# Altium schematic sheet Base.SchDoc
size 420 x 297 mm; PageSetup: Record=PageOptions|CenterHorizontal=True|CenterVertical=True|PrintScale=0.94|XCorrection=1.00|YCorrection=1.00|PrintKind=1|BorderSize=5000000|LeftOffset=0|BottomOffset=0|Orientation=1|PaperLength=1000|PaperWidth=1000|Scale=100|PaperSource=7|PrintQuality=-4|MediaType=1|DitherType=10|PaperKind=A4|PrintScaleMode=1; HeadOfSector: Нач. сектора; Name: Base; NameShort: Основна плата; Litera: A; SCH_VERSION: Версия 0
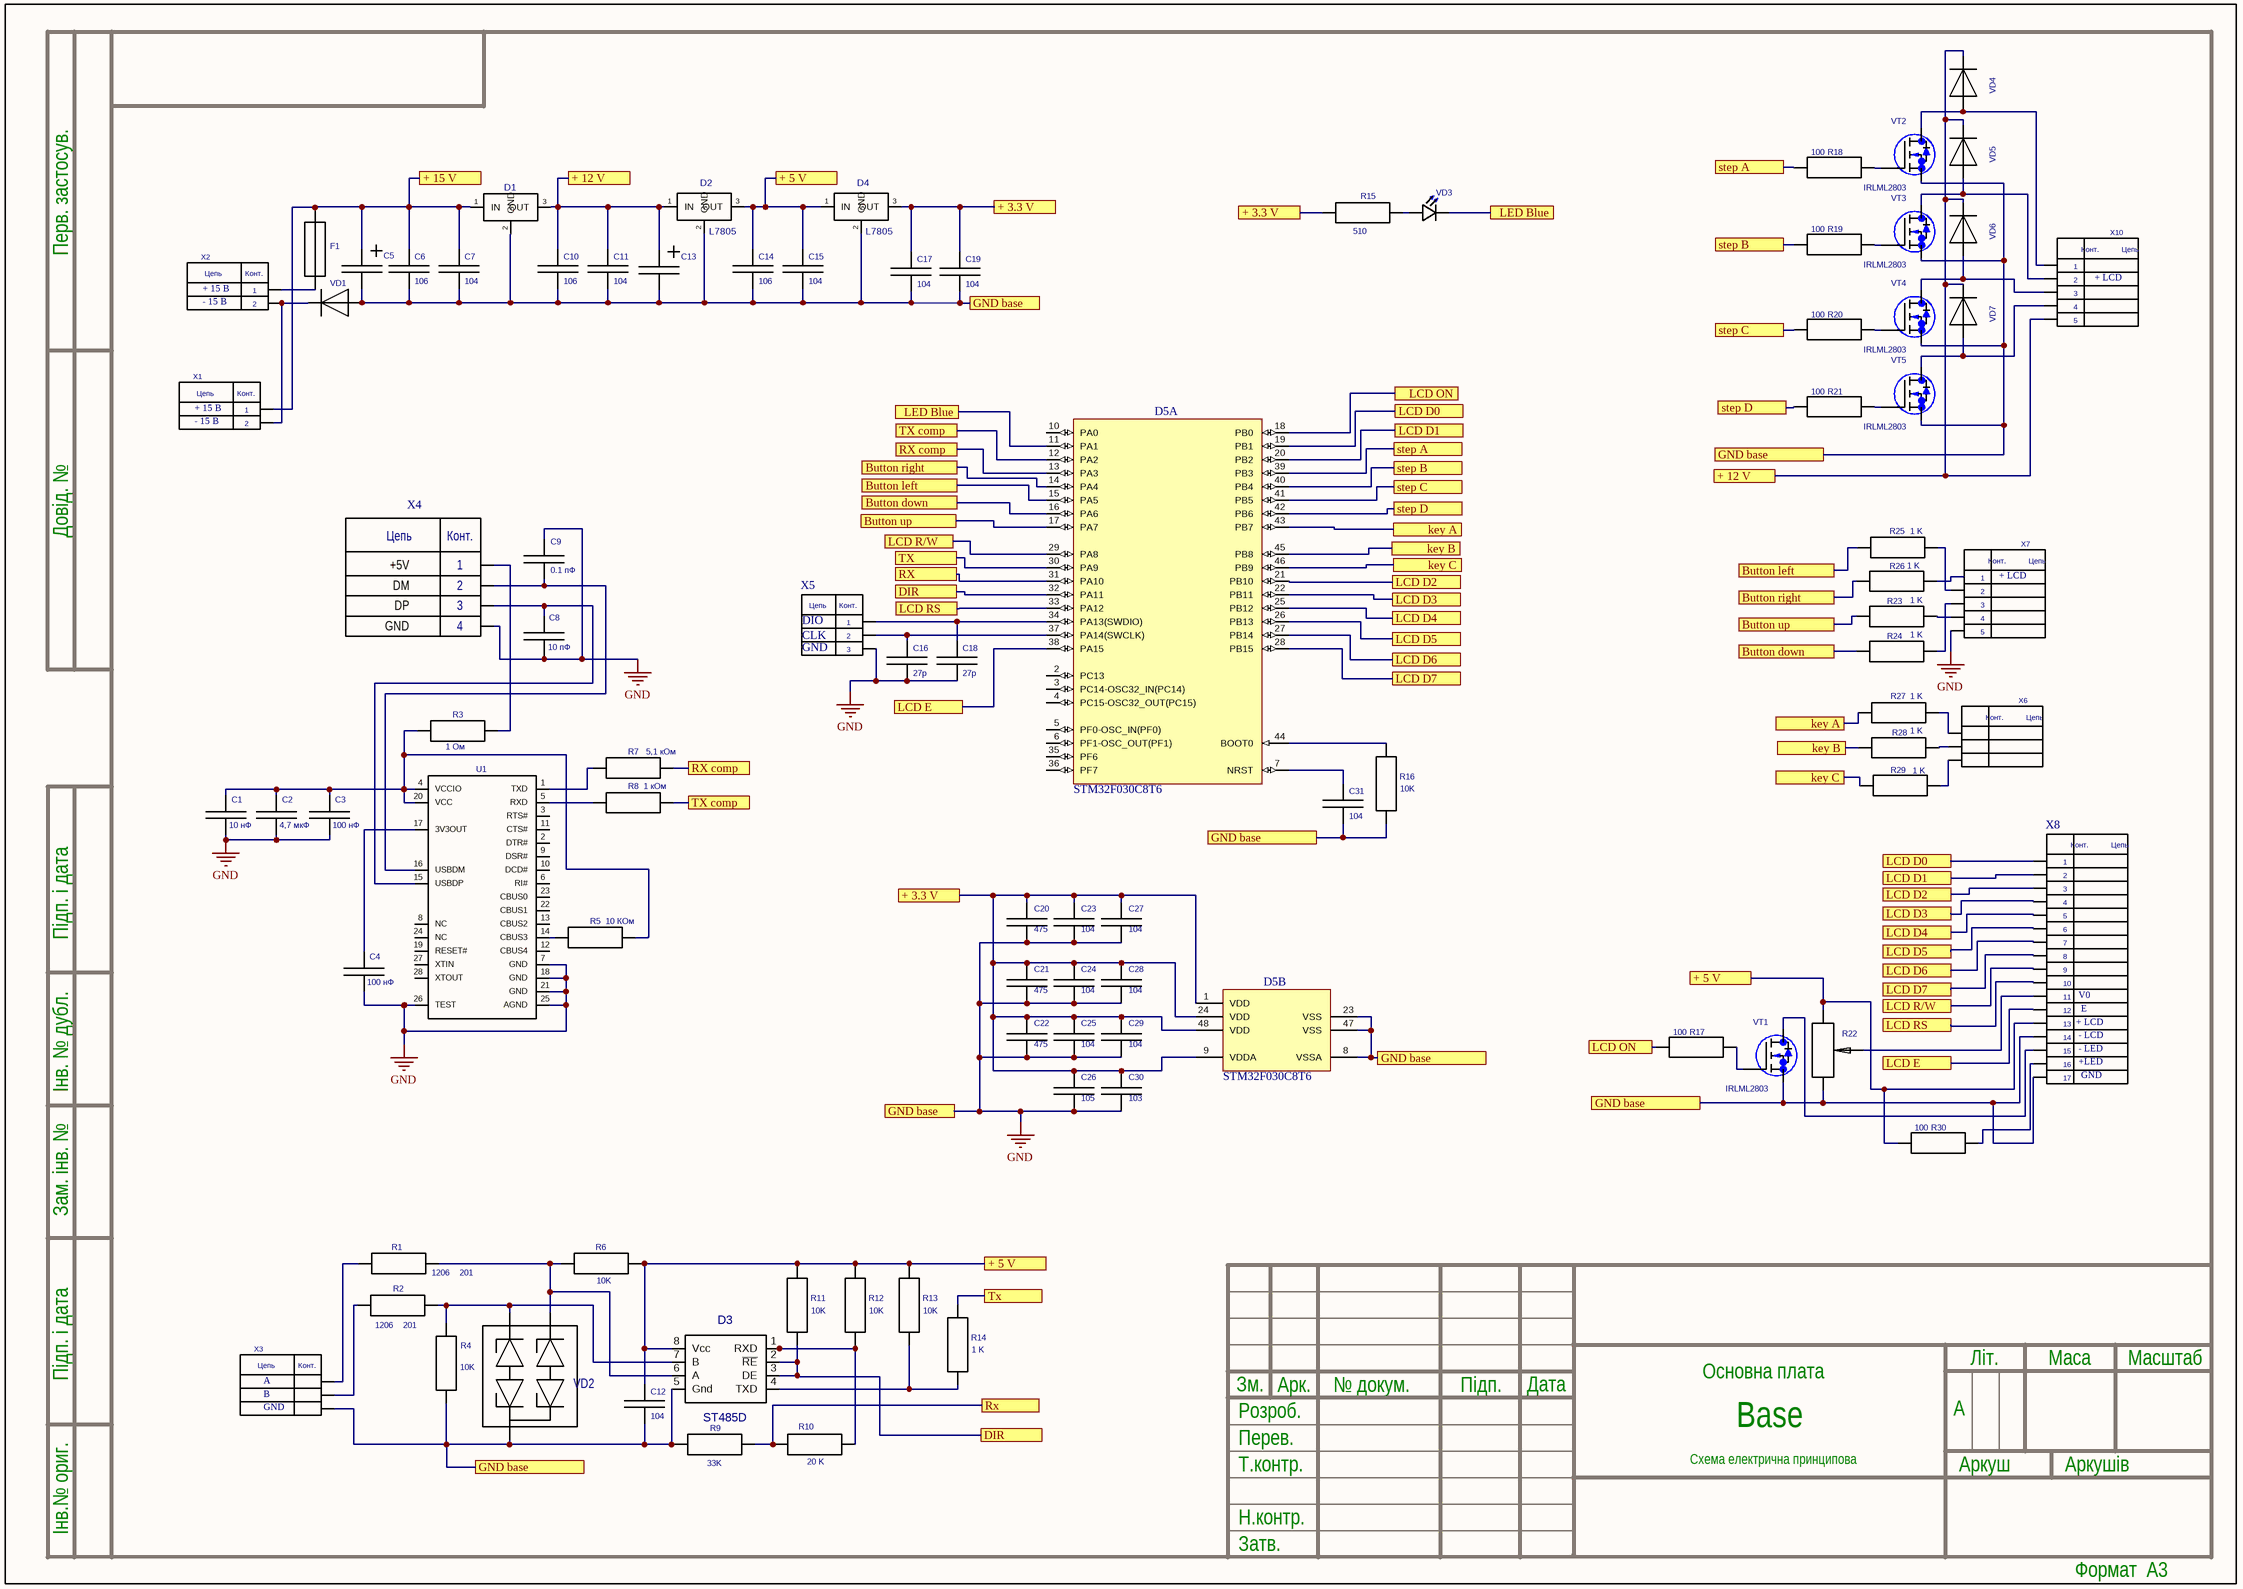
[diagram p0: Base.SchDoc]

## Parts
C1  value 10 нФ  [0805T]  (hidden comment: CC0805)
C2  value 4,7 мкФ  [0805T]  (hidden comment: CC0805)
C3  value 100 нФ  [0805T]  (hidden comment: CC0805)
C4  value 100 нФ  [0805T]  (hidden comment: CC0805)
C5  C-RAD-2_5-6_8  [C_electrolit_smd_7mm]  (value not drawn)
C6  value 106  [0805T]  (hidden comment: CC0805)
C7  value 104  [0805T]  (hidden comment: CC0805)
C8  value 10 пФ  [0805T]  (hidden comment: CC0805)
C9  value 0.1 пФ  [0805T]  (hidden comment: CC0805)
C10  value 106  [0805T]  (hidden comment: CC0805)
C11  value 104  [0805T]  (hidden comment: CC0805)
C12  value 104  [0805T]  (hidden comment: CC0805)
C13  C-RAD-2_5-6_8  [C_electrolit_smd_7mm]  (value not drawn)
C14  value 106  [0805T]  (hidden comment: CC0805)
C15  value 104  [0805T]  (hidden comment: CC0805)
C16  value 27p  [0805T]  (hidden comment: CC0805)
C17  value 104  [0805T]  (hidden comment: CC0805)
C18  value 27p  [0805T]  (hidden comment: CC0805)
C19  value 104  [0805T]  (hidden comment: CC0805)
C20  value 475  [0805T]  (hidden comment: CC0805)
C21  value 475  [0805T]  (hidden comment: CC0805)
C22  value 475  [0805T]  (hidden comment: CC0805)
C23  value 104  [0805T]  (hidden comment: CC0805)
C24  value 104  [0805T]  (hidden comment: CC0805)
C25  value 104  [0805T]  (hidden comment: CC0805)
C26  value 105  [0805T]  (hidden comment: CC0805)
C27  value 104  [0805T]  (hidden comment: CC0805)
C28  value 104  [0805T]  (hidden comment: CC0805)
C29  value 104  [0805T]  (hidden comment: CC0805)
C30  value 103  [0805T]  (hidden comment: CC0805)
C31  value 104  [0805T]  (hidden comment: CC0805)
D1  L78-D2PAK  [D2PAK(IR)]  (value not drawn)
D2  value L7805  [TO92-LM_TL431_TO93(Primary)]  (hidden comment: L78-D2PAK)
D3  ST485D  [SO8]
D4  value L7805  [TO92-LM_TL431_TO93(Primary)]  (hidden comment: L78-D2PAK)
D5  STM32F030C8T6  [LQFP48]  (parts A,B of 2)
F1  F  [F]  (value not drawn)
R1  value 1206    201  [RC1206_IPC]  (hidden comment: 201)
R2  value 1206    201  [RC1206_IPC]  (hidden comment: 201)
R3  value 1 Ом  [RC0805]  (hidden comment: R0805MY)
R4  value 10K  [RC0805]  (hidden comment: R0805MY)
R5  value 10 КОм  [RC0805]  (hidden comment: R0805MY)
R6  value 10K  [RC0805]  (hidden comment: R0805MY)
R7  value 5,1 кОм  [RC0805]  (hidden comment: R0805MY)
R8  value 1 кОм  [RC0805]  (hidden comment: R0805MY)
R9  value 33K  [RC0805]  (hidden comment: R0805MY)
R10  value 20 K  [RC0805]  (hidden comment: R0805MY)
R11  value 10K  [RC0805]  (hidden comment: R0805MY)
R12  value 10K  [RC0805]  (hidden comment: R0805MY)
R13  value 10K  [RC0805]  (hidden comment: R0805MY)
R14  value 1 K  [RC0805]  (hidden comment: R0805MY)
R15  value 510  [RC0805]  (hidden comment: RC0805)
R16  value 10K  [RC0805]  (hidden comment: R0805MY)
R17  value 100  [RC0805]  (hidden comment: R0805MY)
R18  value 100  [RC0805]  (hidden comment: R0805MY)
R19  value 100  [RC0805]  (hidden comment: R0805MY)
R20  value 100  [RC0805]  (hidden comment: R0805MY)
R21  value 100  [RC0805]  (hidden comment: R0805MY)
R22  3362R  [Resistor 3363R]  (value not drawn)
R23  value 1 K  [RC0805]  (hidden comment: R0805MY)
R24  value 1 K  [RC0805]  (hidden comment: R0805MY)
R25  value 1 K  [RC0805]  (hidden comment: R0805MY)
R26  value 1 K  [RC0805]  (hidden comment: R0805MY)
R27  value 1 K  [RC0805]  (hidden comment: R0805MY)
R28  value 1 K  [RC0805]  (hidden comment: R0805MY)
R29  value 1 K  [RC0805]  (hidden comment: R0805MY)
R30  value 100  [RC0805]  (hidden comment: R0805MY)
U1  FT232RL  [SSOP_R28]  (value not drawn)
VD1  DIOD_SOD232  [1N4148_LRG]  (value not drawn)
VD2  CDSOT23-SM712  [SOT-23A]  (value not drawn)
VD3  KP-2012SURK  [RC0805]  (value not drawn)
VD4  DIOD_SOD232  [1N4148_LRG]  (value not drawn)
VD5  DIOD_SOD232  [1N4148_LRG]  (value not drawn)
VD6  DIOD_SOD232  [1N4148_LRG]  (value not drawn)
VD7  DIOD_SOD232  [1N4148_LRG]  (value not drawn)
VT1  IRLML2803  [SOT-23_IPC]
VT2  IRLML2803  [SOT-23_IPC]
VT3  IRLML2803  [SOT-23_IPC]
VT4  IRLML2803  [SOT-23_IPC]
VT5  IRLML2803  [SOT-23_IPC]
X1  TB08-210  [DG___3_5_____2P]  (value not drawn)
X2  TB08-210  [DG___3_5_____2P]  (value not drawn)
X3  DG300-7.5-3P  [DG__3_5____3P]  (value not drawn)
X4  USB_TYPE_B  [TSB4BR]  (value not drawn)
X5  PLS-3  [PLS-3_smd]  (value not drawn)
X6  DG300-7.5-3P  [DG__3_5____3P]  (value not drawn)
X7  CONN_5  [DG_3_5____5P]  (value not drawn)
X8  PLS_17  [PLS_17]  (value not drawn)
X10  CONN_5  [DG_3_5____5P]  (value not drawn)

## Ports
+ 3.3 V, + 5 V, + 12 V, + 15 V, Button down, Button left, Button right, Button up, DIR, GND base, key A, key B, key C, LCD D0, LCD D1, LCD D2, LCD D3, LCD D4, LCD D5, LCD D6, LCD D7, LCD E, LCD ON, LCD R/W, LCD RS, LED Blue, Rx, RX, RX comp, step A, step B, step C, step D, Tx, TX, TX comp

## Nets
GND: C1.1 C2.1 C3.1 C4.1 C5.2(Minus) C6.1 C7.1 C8.1 C9.2 C10.1 C11.1 C12.1 C13.2(Minus) C14.1 C15.1 C16.1 C17.1 C18.1 C19.1 C20.1 C21.1 C22.1 C23.1 C24.1 C25.1 C26.1 C27.1 C28.1 C29.1 C30.1 C31.1 D1.2(GND) D2.2(GND) D3.5(Gnd) D4.2(GND) D5.8(VSSA) D5.23(VSS) D5.47(VSS) R4.1 R9.1 R16.2 R22.3 U1.7(GND) U1.18(GND) U1.21(GND) U1.25(AGND) U1.26(TEST) VD1.1 VD2.3 VT1.2(S) VT2.2(S) VT3.2(S) VT4.2(S) VT5.2(S) X3.3 X4.4(GND) X5.3 X7.5 X8.14 X8.17 ; port GND base
+ 3.3 V: C17.2 C19.2 C20.2 C21.2 C22.2 C23.2 C24.2 C25.2 C26.2 C27.2 C28.2 C29.2 C30.2 D4.3(OUT) D5.1(VDD) D5.9(VDDA) D5.24(VDD) D5.48(VDD) R15.1 ; port + 3.3 V
+ 5 V: C12.2 C14.2 C15.2 D2.3(OUT) D3.8(Vcc) D4.1(IN) R6.2 R11.1 R12.1 R13.1 R22.1 R30.2 X8.13 ; port + 5 V
+ 12 V: C10.2 C11.2 C13.1(Plus) D1.3(OUT) D2.1(IN) VD4.2 VD5.2 VD6.2 VD7.2 X10.5 ; port + 12 V
+ 15 V: C5.1(Plus) C6.2 C7.2 D1.1(IN) F1.2 X1.1 ; port + 15 V
Button down: D5.16(PA6) R24.2 ; port Button down
Button left: D5.15(PA5) R25.2 ; port Button left
Button right: D5.14(PA4) R26.2 ; port Button right
Button up: D5.17(PA7) R23.2 ; port Button up
DIR: D3.2(~{RE}) D3.3(DE) D5.32(PA11) R11.2 ; port DIR
key A: D5.43(PB7) R27.2 ; port key A
key B: D5.45(PB8) R28.2 ; port key B
key C: D5.46(PB9) R29.2 ; port key C
LCD D0: D5.19(PB1) X8.1 ; port LCD D0
LCD D1: D5.20(PB2) X8.2 ; port LCD D1
LCD D2: D5.21(PB10) X8.3 ; port LCD D2
LCD D3: D5.22(PB11) X8.4 ; port LCD D3
LCD D4: D5.25(PB12) X8.5 ; port LCD D4
LCD D5: D5.26(PB13) X8.6 ; port LCD D5
LCD D6: D5.27(PB14) X8.7 ; port LCD D6
LCD D7: D5.28(PB15) X8.8 ; port LCD D7
LCD E: D5.38(PA15) X8.12 ; port LCD E
LCD ON: D5.18(PB0) R17.2 ; port LCD ON
LCD R/W: D5.29(PA8) X8.9 ; port LCD R/W
LCD RS: D5.33(PA12) X8.10 ; port LCD RS
LED Blue: D5.11(PA1) VD3.2 ; port LED Blue
Rx: D5.31(PA10) R9.2 R10.1 ; port Rx, port RX
RX comp: D5.13(PA3) R7.1 ; port RX comp
step A: D5.39(PB3) R18.2 ; port step A
step B: D5.40(PB4) R19.2 ; port step B
step C: D5.41(PB5) R20.2 ; port step C
step D: D5.42(PB6) R21.2 ; port step D
Tx: D5.30(PA9) R14.1 ; port Tx, port TX
TX comp: D5.12(PA2) R8.1 ; port TX comp
NetC1_2: C1.2 C2.2 C3.2 R3.2 R5.1 U1.4(VCCIO) U1.20(VCC)
NetC4_2: C4.2 U1.17(3V3OUT)
NetC8_2: C8.2 U1.15(USBDP) X4.3(DP)
NetC9_1: C9.1 U1.16(USBDM) X4.2(DM)
NetC16_2: C16.2 D5.37(PA14(SWCLK)) X5.2
NetC18_2: C18.2 D5.34(PA13(SWDIO)) X5.1
NetC31_2: C31.2 D5.7(NRST)
NetD3_1: D3.1(RXD) R10.2 R12.2
NetD3_4: D3.4(TXD) R13.2 R14.2
NetD3_6: D3.6(A) R1.1 R6.1 VD2.1
NetD3_7: D3.7(B) R2.1 R4.2 VD2.2
NetD5_44: D5.44(BOOT0) R16.1
NetF1_1: F1.1 X2.1
NetR1_2: R1.2 X3.1
NetR2_2: R2.2 X3.2
NetR3_1: R3.1 X4.1(+5V)
NetR5_2: R5.2 U1.14(CBUS3)
NetR7_2: R7.2 U1.1(TXD)
NetR8_2: R8.2 U1.5(RXD)
NetR15_2: R15.2 VD3.1
NetR17_1: R17.1 VT1.1(G)
NetR18_1: R18.1 VT2.1(G)
NetR19_1: R19.1 VT3.1(G)
NetR20_1: R20.1 VT4.1(G)
NetR21_1: R21.1 VT5.1(G)
NetR22_2: R22.2 X8.11
NetR23_1: R23.1 X7.4
NetR24_1: R24.1 X7.3
NetR25_1: R25.1 X7.2
NetR26_1: R26.1 X7.1
NetR27_1: R27.1 X6.1
NetR28_1: R28.1 X6.2
NetR29_1: R29.1 X6.3
NetR30_1: R30.1 X8.16
NetVD1_2: VD1.2 X1.2 X2.2
NetVD4_1: VD4.1 VT2.3(D) X10.1
NetVD5_1: VD5.1 VT3.3(D) X10.2
NetVD6_1: VD6.1 VT4.3(D) X10.3
NetVD7_1: VD7.1 VT5.3(D) X10.4
NetVT1_3: VT1.3(D) X8.15

Not connected (* = marked no-connect by the designer): D5 2(PC13) 3(PC14-OSC32_IN(PC14)) 4(PC15-OSC32_OUT(PC15)) 5(PF0-OSC_IN(PF0)) 6(PF1-OSC_OUT(PF1)) 10(PA0) 35(PF6) 36(PF7); U1 2(DTR#) 3(RTS#) 6(RI#) 8(NC) 9(DSR#) 10(DCD#) 11(CTS#) 12(CBUS4) 13(CBUS2) 19(RESET#) 22(CBUS1) 23(CBUS0) 24(NC) 27(XTIN) 28(XTOUT)

## Notes on the sheet
- (near X2) + 15 В
- (near X2) - 15 В
- (near X10) + LCD
- (near X1) + 15 В
- (near X1) - 15 В
- (near X7) + LCD
- (near X5) GND
- (near X5) CLK
- (near X5) DIO
- (near X8) V0
- (near X8) + LCD
- (near X8) - LCD
- (near X8) - LED
- (near X8) +LED
- (near X8) E
- (near X8) GND
- (near X3) A
- (near X3) B
- (near X3) GND
- Перв. застосув.
- Довід. №
- Підп. і дата
- Інв. № дубл.
- Зам. інв. №
- Розроб.
- Зм.
- Арк.
- № докум.
- Підп.
- Дата
- Літ.
- Маса
- Масштаб
- Т.контр.
- Перев.
- Схема електрична принципова
- Аркуш
- Аркушів
- Інв.№ ориг.
- Затв.
- Н.контр.
- Формат  A3
- (in symbol CONN_5) Конт.; Цепь
- (in symbol DG300-7.5-3P) Цепь; Конт.
- (in symbol PLS-3) Цепь; Конт.
- (in symbol PLS_17) Конт.; Цепь
- (in symbol TB08-210) Цепь; Конт.
- (in symbol USB_TYPE_B) Цепь; Конт.

## Library data of the parts
C5 C13 = C-RAD-2_5-6_8: Value: {Value}
D1 = L78-D2PAK: Value: {Value}
D5 = STM32F030C8T6: ARM Cortex-M0 32-bit MCU, 64 KB Flash, 8 KB Internal RAM, 39 I/Os, 48-pin LQFP, -40 to 85 degC, Tray; FLASH Size (Prog) (kB): 64; I/Os (High Current): 39; Internal RAM Size (kB): 8; Operating Frequency(F) (Processor speed) (MHz): 48; Supply Voltage(Vcc) min (V): 2.4; DatasheetVersion: Rev. 1; PackageVersion: Rev. 6, 06/2013; PackageReference: LQFP48; PackageDescription: 48-Pin Low Profile Quad Flat Package, 7 x 7 mm Body, 0.5 mm Pitch; Supplier 1: Digi-Key; Supplier Part Number 1: 497-14043-ND; Supplier 2: Newark; Supplier Part Number 2: 06X3647; Supplier 3: Mouser; Supplier Part Number 3: 511-STM32F030C8T6; Core: ARM Cortex-M0; Packing: Tray; Mounting Technology: Surface Mount; PartNumber: STM32F030C8T6; ComponentLink1Description: Manufacturer URL; ComponentLink1URL: http://www.st.com/web/en/home.html; ComponentLink2Description: Datasheet; ComponentLink2URL: http://www.st.com/st-web-ui/static/active/en/resource/technical/document/datasheet/DM00088500.pdf; ComponentLink3Description: Package Specification; ComponentLink3URL: http://www.st.com/st-web-ui/static/active/en/resource/technical/document/datasheet/DM00058181.pdf
F1 = F: Value: {Value}
R1 = R0805MY
R2 = R1206_IPC
R22 = 3362R: Value: {Value}
VT1-VT5 = IRLML2803: N-Channel Enhancement-Mode MOSFET (TMOS); Value: *
X4 = USB_TYPE_B: Розетка; Note: *; Value: *; Price: *
D3 = ST485D: Value: *
U1 = FT232RL: Value: *
VD1 VD4-VD7 = DIOD_SOD232: Value: *
VD2 = CDSOT23-SM712: Value: *
VD3 = KP-2012SURK: Value: *
X1 X2 = TB08-210: Value: *
X3 X6 = DG300-7.5-3P: Value: *
X7 X10 = CONN_5: Value: *